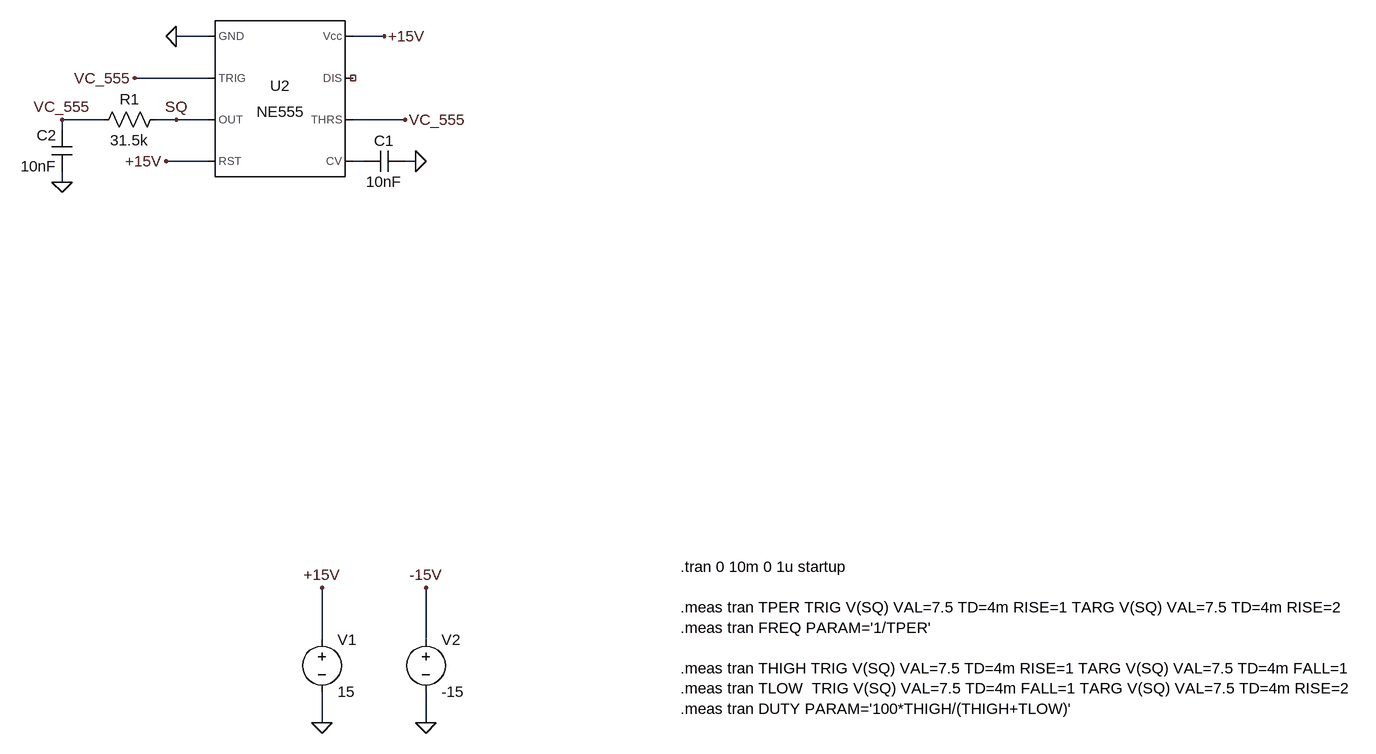
[diagram p0: schematic sintetizador_completo_LF353 - copia.asc]
sintetizador_completo_LF353 - copia.asc, the LTspice schematic file:
Version 4.1
SHEET 1 1600 948
WIRE -336 -128 -384 -128
WIRE -64 -128 -112 -128
WIRE -336 -64 -448 -64
WIRE -496 0 -560 0
WIRE -384 0 -416 0
WIRE -336 0 -384 0
WIRE -32 0 -112 0
WIRE -560 16 -560 0
WIRE -336 64 -400 64
WIRE -96 64 -112 64
WIRE -16 64 -32 64
WIRE -560 96 -560 80
WIRE -160 800 -160 720
WIRE 0 800 0 720
WIRE -160 928 -160 880
WIRE 0 928 0 880
FLAG -160 928 0
FLAG 0 928 0
FLAG -160 720 +15V
FLAG 0 720 -15V
FLAG -384 -128 0
FLAG -400 64 +15V
FLAG -16 64 0
FLAG -64 -128 +15V
FLAG -384 0 SQ
FLAG -32 0 VC_555
FLAG -448 -64 VC_555
FLAG -560 0 VC_555
FLAG -560 96 0
SYMBOL voltage -160 784 R0
WINDOW 123 0 0 Left 0
WINDOW 39 0 0 Left 0
SYMATTR InstName V1
SYMATTR Value 15
SYMBOL voltage 0 784 R0
WINDOW 123 0 0 Left 0
WINDOW 39 0 0 Left 0
SYMATTR InstName V2
SYMATTR Value -15
SYMBOL Misc\\NE555 -224 -32 R0
SYMATTR InstName U2
SYMBOL cap -32 48 R90
WINDOW 0 0 32 VBottom 2
WINDOW 3 32 32 VTop 2
SYMATTR InstName C1
SYMATTR Value 10nF
SYMBOL res -400 -16 R90
WINDOW 0 0 56 VBottom 2
WINDOW 3 32 56 VTop 2
SYMATTR InstName R1
SYMATTR Value 31.5k
SYMBOL cap -544 80 R180
WINDOW 0 24 56 Left 2
WINDOW 3 24 8 Left 2
SYMATTR InstName C2
SYMATTR Value 10nF
TEXT 392 688 Left 2 !.tran 0 10m 0 1u startup\n \n.meas tran TPER TRIG V(SQ) VAL=7.5 TD=4m RISE=1 TARG V(SQ) VAL=7.5 TD=4m RISE=2\n.meas tran FREQ PARAM='1/TPER'\n \n.meas tran THIGH TRIG V(SQ) VAL=7.5 TD=4m RISE=1 TARG V(SQ) VAL=7.5 TD=4m FALL=1\n.meas tran TLOW  TRIG V(SQ) VAL=7.5 TD=4m FALL=1 TARG V(SQ) VAL=7.5 TD=4m RISE=2\n.meas tran DUTY PARAM='100*THIGH/(THIGH+TLOW)'

The netlist it stands for:
* sintetizador_completo_LF353 - copia.asc
V1 +15V 0 15
V2 -15V 0 -15
X§U2 0 VC_555 SQ +15V N001 VC_555 NC_01 +15V NE555  ; pins GND TRIG OUT RST CV THRS DIS Vcc
C1 0 N001 10nF
R1 SQ VC_555 31.5k
C2 0 VC_555 10nF
.tran 0 10m 0 1u startup
.meas tran TPER TRIG V(SQ) VAL=7.5 TD=4m RISE=1 TARG V(SQ) VAL=7.5 TD=4m RISE=2
.meas tran FREQ PARAM='1/TPER'
.meas tran THIGH TRIG V(SQ) VAL=7.5 TD=4m RISE=1 TARG V(SQ) VAL=7.5 TD=4m FALL=1
.meas tran TLOW  TRIG V(SQ) VAL=7.5 TD=4m FALL=1 TARG V(SQ) VAL=7.5 TD=4m RISE=2
.meas tran DUTY PARAM='100*THIGH/(THIGH+TLOW)'
.lib NE555.sub
.backanno
.end